# Altium project BopIt Dev.PrjPcb
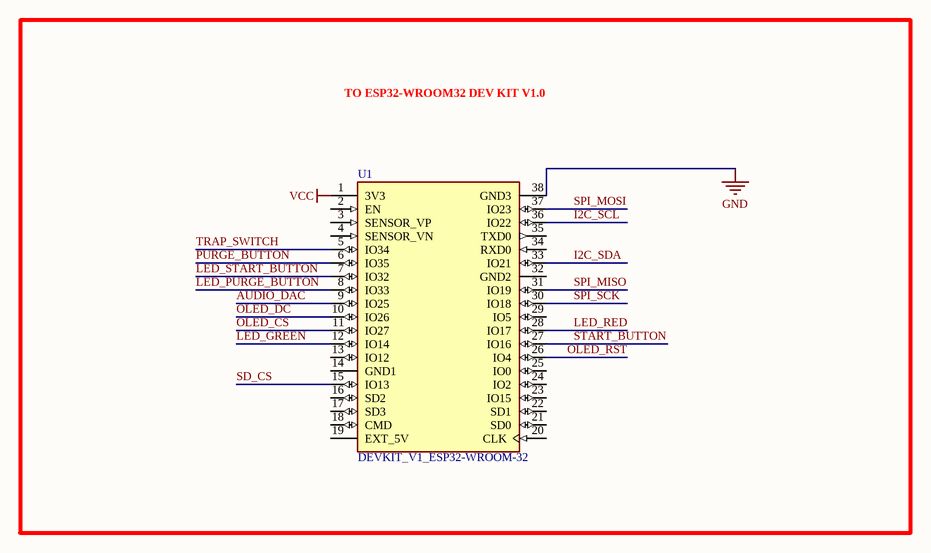
[diagram p0: DevKitESP32.SchDoc]
6 sheets, 20 parts. Net scope: global (net labels, ports and power ports of the same name join across sheets).
Board file: Motherboard.PcbDoc
Sheets:
  DevKitESP32.SchDoc
  Audio.SchDoc
  Display.SchDoc
  Inputs.SchDoc
  Regulators.SchDoc
  Button LED Power.SchDoc

## Sheet DevKitESP32.SchDoc
size A; SheetNumber: 1; SheetTotal: 6

### Parts
U1  DEVKIT_V1_ESP32-WROOM-32  [MODULE_DEVKIT_V1_ESP32-WROOM-32]

### Blocks framed on the sheet
TO ESP32-WROOM32 DEV KIT V1.0: U1

### Nets
GND: U1.38(GND3)
VCC: U1.1(3V3)
AUDIO_DAC: U1.9(IO25)
I2C_SCL: U1.36(IO22)
I2C_SDA: U1.33(IO21)
LED_GREEN: U1.12(IO14)
LED_PURGE_BUTTON: U1.8(IO33)
LED_RED: U1.28(IO17)
LED_START_BUTTON: U1.7(IO32)
OLED_CS: U1.11(IO27)
OLED_DC: U1.10(IO26)
OLED_RST: U1.26(IO4)
PURGE_BUTTON: U1.6(IO35)
SD_CS: U1.15(IO13)
SPI_MISO: U1.31(IO19)
SPI_MOSI: U1.37(IO23)
SPI_SCK: U1.30(IO18)
START_BUTTON: U1.27(IO16)
TRAP_SWITCH: U1.5(IO34)

Not connected (* = marked no-connect by the designer): U1 2(EN) 3(SENSOR_VP) 4(SENSOR_VN) 13(IO12) 14(GND1) 16(SD2) 17(SD3) 18(CMD) 19(EXT_5V) 20(CLK) 21(SD0) 22(SD1) 23(IO15) 24(IO2) 25(IO0) 29(IO5) 32(GND2) 34(RXD0) 35(TXD0)

### Library data of the parts
U1 = DEVKIT_V1_ESP32-WROOM-32: WROOM-32 Development Board ESP32 ESP-32S WiFi Bluetooth Dev Module; MF: Espressif Systems; MP: DEVKIT V1 ESP32-WROOM-32; SnapEDA_Link: https://www.snapeda.com/parts/DEVKIT%20V1%20ESP32-WROOM-32/Espressif+Systems/view-part/?ref=snap; Package: Package; Value: *; Check_prices: https://www.snapeda.com/parts/DEVKIT%20V1%20ESP32-WROOM-32/Espressif+Systems/view-part/?ref=eda

## Sheet Audio.SchDoc
size A; SheetNumber: 2; SheetTotal: 5
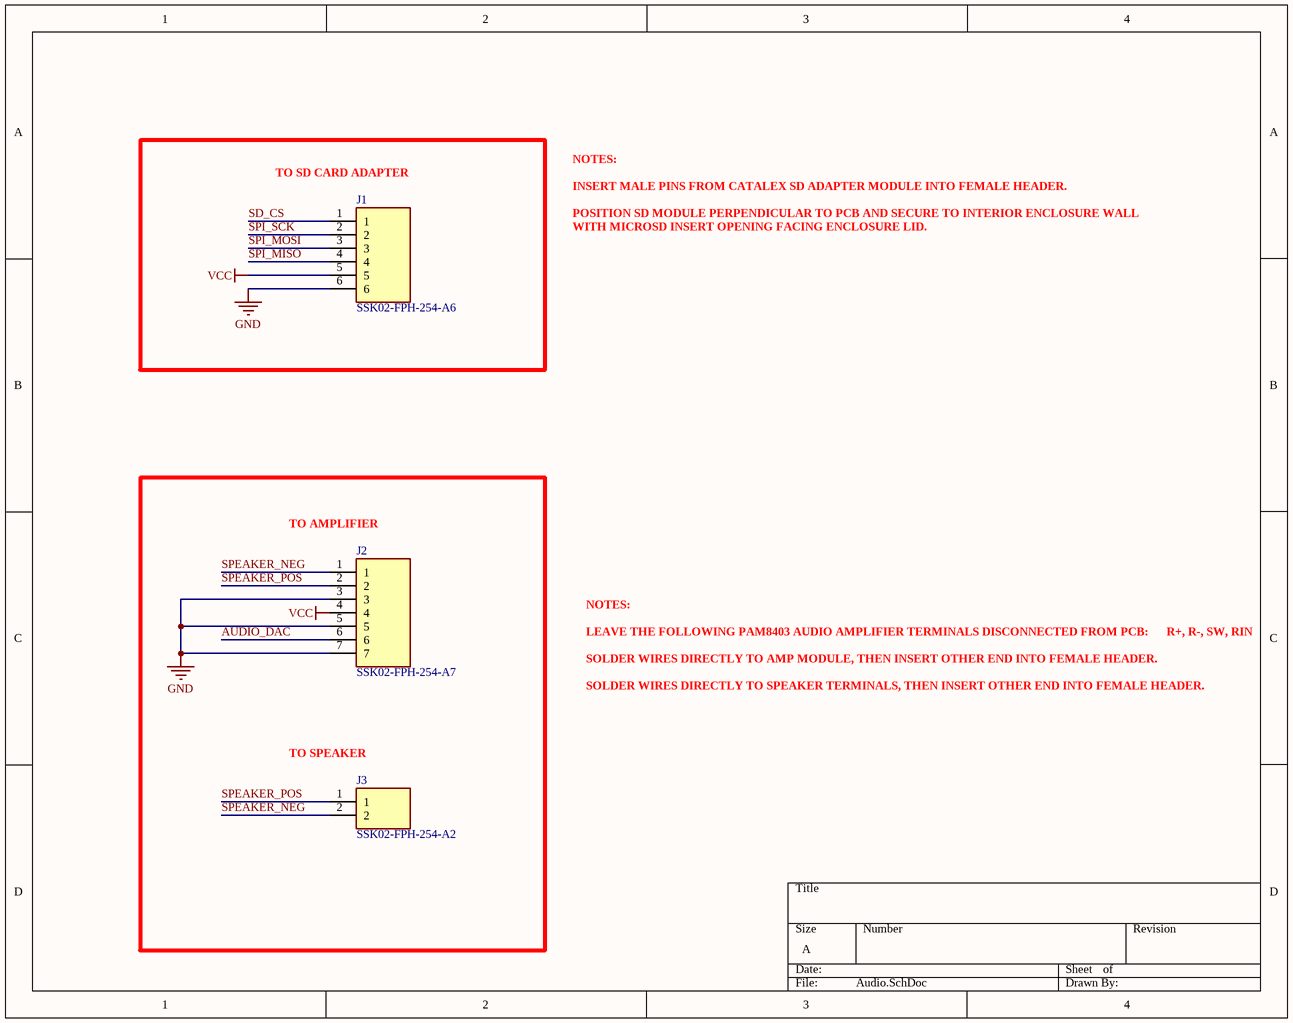
[diagram p1: Audio.SchDoc]

### Parts
J1  SSK02-FPH-254-A6  [SAMESKY_SSK02-FPH-254-A6]
J2  SSK02-FPH-254-A7  [SAMESKY_SSK02-FPH-254-A7]
J3  SSK02-FPH-254-A2  [SAMESKY_SSK02-FPH-254-A2]

### Blocks framed on the sheet
TO SD CARD ADAPTER: J1

### Nets
GND: J1.6 J2.3 J2.5 J2.7
VCC: J1.5 J2.4
AUDIO_DAC: J2.6
SD_CS: J1.1
SPEAKER_NEG: J2.1 J3.2
SPEAKER_POS: J2.2 J3.1
SPI_MISO: J1.4
SPI_MOSI: J1.3
SPI_SCK: J1.2

### Notes on the sheet
- NOTES:
- INSERT MALE PINS FROM CATALEX SD ADAPTER MODULE INTO FEMALE HEADER.
- POSITION SD MODULE PERPENDICULAR TO PCB AND SECURE TO INTERIOR ENCLOSURE WALL
- WITH MICROSD INSERT OPENING FACING ENCLOSURE LID.
- (near J2) TO AMPLIFIER
- LEAVE THE FOLLOWING PAM8403 AUDIO AMPLIFIER TERMINALS DISCONNECTED FROM PCB:
- R+, R-, SW, RIN
- SOLDER WIRES DIRECTLY TO AMP MODULE, THEN INSERT OTHER END INTO FEMALE HEADER.
- SOLDER WIRES DIRECTLY TO SPEAKER TERMINALS, THEN INSERT OTHER END INTO FEMALE HEADER.
- (near J3) TO SPEAKER

### Library data of the parts
J1 = SSK02-FPH-254-A6: 6 Position Header Connector 0.100 (2.54mm) Through Hole Gold; MF: Same Sky (Formerly CUI Devices); SnapEDA_Link: https://www.snapeda.com/parts/SSK02-FPH-254-A6/Same+Sky/view-part/?ref=snap; Package: None; Value: *; MP: SSK02-FPH-254-A6; Check_prices: https://www.snapeda.com/parts/SSK02-FPH-254-A6/Same+Sky/view-part/?ref=eda
J2 = SSK02-FPH-254-A7: MF: {'manufacturer': u'Same Sky (Formerly CUI Devices)'}; Package: None; Price: None; Value: *; MP: SSK02-FPH-254-A7; Availability: Unavailable
J3 = SSK02-FPH-254-A2: 2 Position Header Connector 0.100 (2.54mm) Through Hole Gold; MF: Same Sky (Formerly CUI Devices); SnapEDA_Link: https://www.snapeda.com/parts/SSK02-FPH-254-A2/Same+Sky/view-part/?ref=snap; Package: None; Value: *; MP: SSK02-FPH-254-A2; Check_prices: https://www.snapeda.com/parts/SSK02-FPH-254-A2/Same+Sky/view-part/?ref=eda

## Sheet Display.SchDoc
size A; SheetNumber: 3; SheetTotal: 5
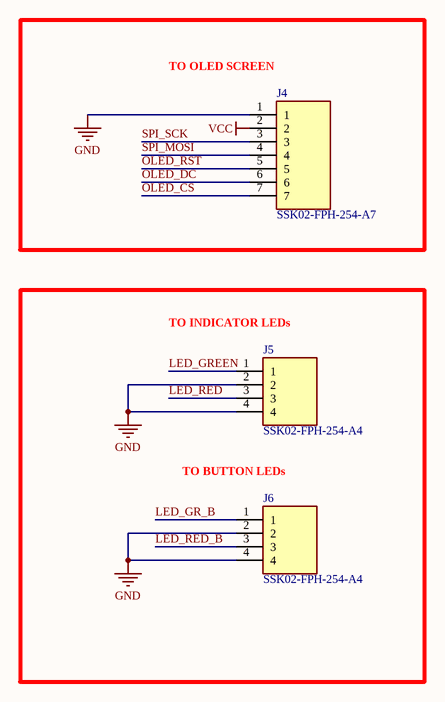
[diagram p2: Display.SchDoc]

### Parts
J4  SSK02-FPH-254-A7  [SAMESKY_SSK02-FPH-254-A7]
J5  SSK02-FPH-254-A4  [SAMESKY_SSK02-FPH-254-A4]
J6  SSK02-FPH-254-A4  [SAMESKY_SSK02-FPH-254-A4]

### Blocks framed on the sheet
TO OLED SCREEN: J4

### Nets
GND: J4.1 J5.2 J5.4 J6.2 J6.4
VCC: J4.2
LED_GR_B: J6.1
LED_GREEN: J5.1
LED_RED: J5.3
LED_RED_B: J6.3
OLED_CS: J4.7
OLED_DC: J4.6
OLED_RST: J4.5
SPI_MOSI: J4.4
SPI_SCK: J4.3

### Notes on the sheet
- (near J5) TO INDICATOR LEDs
- TO BUTTON LEDs

### Library data of the parts
J4 = SSK02-FPH-254-A7: as J2 on sheet Audio; Package: None; Price: None; Value: *; MP: SSK02-FPH-254-A7; Availability: Unavailable
J5 J6 = SSK02-FPH-254-A4: 4 Position Header Connector 0.100 (2.54mm) Through Hole Gold; MF: Same Sky (Formerly CUI Devices); SnapEDA_Link: https://www.snapeda.com/parts/SSK02-FPH-254-A4/Same+Sky/view-part/?ref=snap; Package: None; Value: *; MP: SSK02-FPH-254-A4; Check_prices: https://www.snapeda.com/parts/SSK02-FPH-254-A4/Same+Sky/view-part/?ref=eda

## Sheet Inputs.SchDoc
size A; SheetNumber: 4; SheetTotal: 5
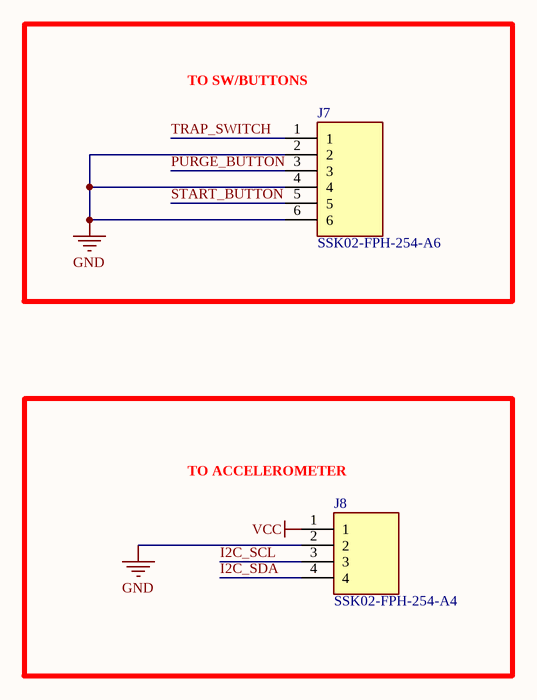
[diagram p3: Inputs.SchDoc]

### Parts
J7  SSK02-FPH-254-A6  [SAMESKY_SSK02-FPH-254-A6]
J8  SSK02-FPH-254-A4  [SAMESKY_SSK02-FPH-254-A4]

### Blocks framed on the sheet
TO SW/BUTTONS: J7
TO ACCELEROMETER: J8

### Nets
GND: J7.2 J7.4 J7.6 J8.2
VCC: J8.1
I2C_SCL: J8.3
I2C_SDA: J8.4
PURGE_BUTTON: J7.3
START_BUTTON: J7.5
TRAP_SWITCH: J7.1

### Library data of the parts
J7 = SSK02-FPH-254-A6: as J1 on sheet Audio; SnapEDA_Link: https://www.snapeda.com/parts/SSK02-FPH-254-A6/Same+Sky/view-part/?ref=snap; Package: None; Value: *; MP: SSK02-FPH-254-A6; Check_prices: https://www.snapeda.com/parts/SSK02-FPH-254-A6/Same+Sky/view-part/?ref=eda
J8 = SSK02-FPH-254-A4: as J5 on sheet Display; SnapEDA_Link: https://www.snapeda.com/parts/SSK02-FPH-254-A4/Same+Sky/view-part/?ref=snap; Package: None; Value: *; MP: SSK02-FPH-254-A4; Check_prices: https://www.snapeda.com/parts/SSK02-FPH-254-A4/Same+Sky/view-part/?ref=eda

## Sheet Regulators.SchDoc
size A; SheetNumber: 5; SheetTotal: 6
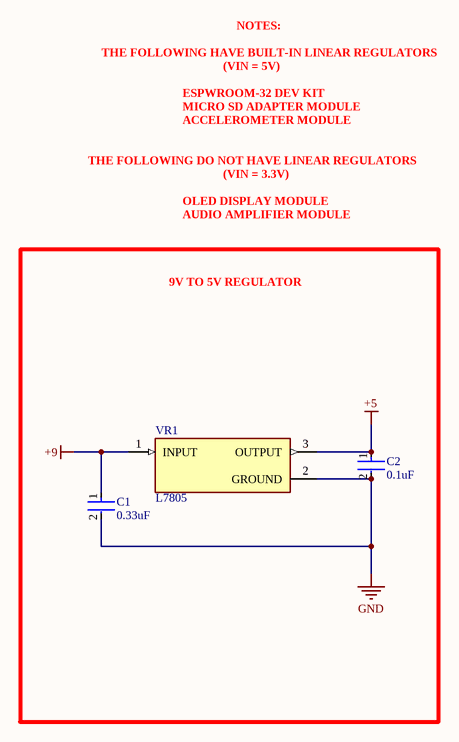
[diagram p4: Regulators.SchDoc]

### Parts
C1  0.33uF  [FP-RHE1DB-MFG]
C2  0.1uF  [FP-RHE1DB-MFG]
VR1  L7805  [TO255P1020X450X2000-3]

### Blocks framed on the sheet
9V TO 5V REGULATOR: C1 C2 VR1

### Nets
+5: C2.1 VR1.3(OUTPUT)
+9: C1.1 VR1.1(INPUT)
GND: C1.2 C2.2 VR1.2(GROUND)

### Notes on the sheet
- THE FOLLOWING HAVE BUILT-IN LINEAR REGULATORS
- (VIN = 5V)
- NOTES:
- MICRO SD ADAPTER MODULE
- ACCELEROMETER MODULE
- ESPWROOM-32 DEV KIT
- THE FOLLOWING DO NOT HAVE LINEAR REGULATORS
- OLED DISPLAY MODULE
- AUDIO AMPLIFIER MODULE
- (VIN = 3.3V)

### Library data of the parts
C1 C2 = CMP-06035-012170-1: Ceramic Capacitor Automotive 330nF ±10% 50V X8L Radial; Tolerance: 10%; Lead Pitch: 2.5mm; Capacitance: 330nF; Max Operating Temperature: 150°C; Dielectric: X8L; Voltage Rating: 50V; Voltage Rating (DC): 50V; Min Operating Temperature: -55°C; REACH SVHC: No SVHC
VR1 = L7805: Standard Regulator Pos 5V 1.5A 3-Pin(3+Tab) TO-220FP Tube; MF: STMicroelectronics; MP: L7805; Value: *; SnapEDA_Link: https://www.snapeda.com/parts/L7805/STMicroelectronics/view-part/?ref=snap; Price: None; Package: None; Check_prices: https://www.snapeda.com/parts/L7805/STMicroelectronics/view-part/?ref=eda; Availability: Not in stock

## Sheet Button LED Power.SchDoc
size A; SheetNumber: 6; SheetTotal: 6
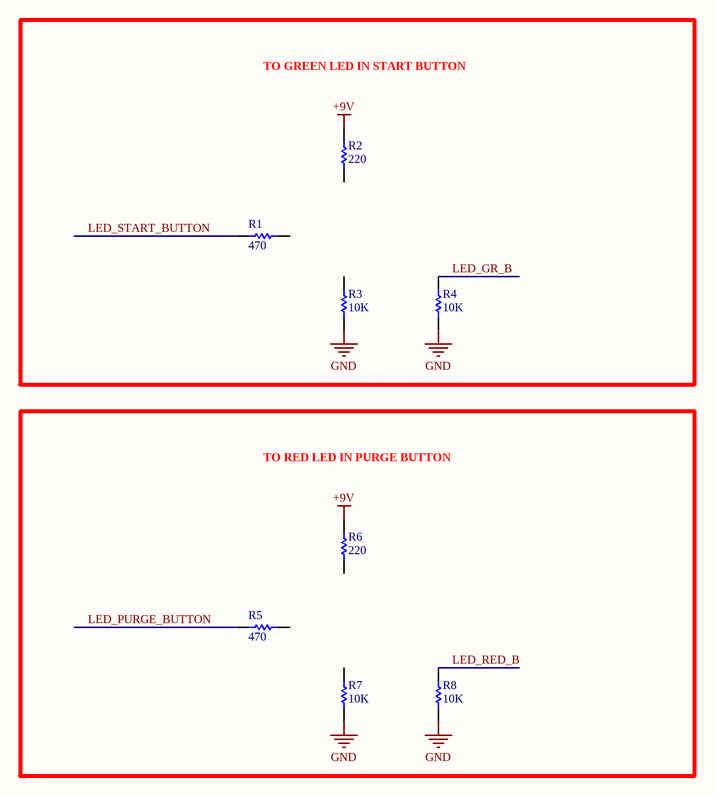
[diagram p5: Button LED Power.SchDoc]

### Parts
R1  470  [RESA60-630X240]
R2  220  [RESA60-630X240]
R3  10K  [RESA60-630X240]
R4  10K  [RESA60-630X240]
R5  470  [RESA60-630X240]
R6  220  [RESA60-630X240]
R7  10K  [RESA60-630X240]
R8  10K  [RESA60-630X240]

### Blocks framed on the sheet
TO GREEN LED IN START BUTTON: R1-R4
TO RED LED IN PURGE BUTTON: R5-R8

### Nets
+9V: R2.2 R6.2
GND: R3.1 R4.1 R7.1 R8.1
LED_GR_B: R4.2
LED_PURGE_BUTTON: R5.1
LED_RED_B: R8.2
LED_START_BUTTON: R1.1

Not connected (* = marked no-connect by the designer): R1 2; R2 1; R3 2; R5 2; R6 1; R7 2

### Library data of the parts
R1-R8 = CMP-1659-00070-1: Axial Resistor, 1 MOhm, +/- 1%, 250 mW, -55 to 155 degC, 2-Pin THD, RoHS, Bulk; Power Rating: 250 mW; Resistance: 47.5 kohm; Voltage Rating: 250 V; ComponentLink1Description: Manufacturer URL; PackageReference: MFR-25; ComponentLink2Description: Datasheet; ComponentLink2URL: http://www.yageo.com/documents/recent/Yageo%20LR_MFR_2013.pdf; Tolerance: 1%; DatasheetVersion: Apr-13; Package Quantity: 200; Packaging: Bulk; Case\Package: Axial; RoHSCompliant: true; ComponentLink1URL: http://www.yageo.com/; Length: 0.248 inch; Min Operating Temperature: -55 degC; Mount: Through Hole; PackageDescription: 2-Pin Axial Lead, Dia 2.4 mm, Body Length 6.3 mm; Max Operating Temperature: 155 degC

## Nets that join several sheets
GND: DevKitESP32 (U1.38), Audio (J1.6 J2.3 J2.5 J2.7), Display (5 pins), Inputs (J7.2 J7.4 J7.6 J8.2), Regulators (C1.2 C2.2 VR1.2), Button LED Power (R3.1 R4.1 R7.1 R8.1)
VCC: DevKitESP32 (U1.1), Audio (J1.5 J2.4), Display (J4.2), Inputs (J8.1)
AUDIO_DAC: DevKitESP32 (U1.9), Audio (J2.6)
I2C_SCL: DevKitESP32 (U1.36), Inputs (J8.3)
I2C_SDA: DevKitESP32 (U1.33), Inputs (J8.4)
LED_GR_B: Display (J6.1), Button LED Power (R4.2)
LED_GREEN: DevKitESP32 (U1.12), Display (J5.1)
LED_PURGE_BUTTON: DevKitESP32 (U1.8), Button LED Power (R5.1)
LED_RED: DevKitESP32 (U1.28), Display (J5.3)
LED_RED_B: Display (J6.3), Button LED Power (R8.2)
LED_START_BUTTON: DevKitESP32 (U1.7), Button LED Power (R1.1)
OLED_CS: DevKitESP32 (U1.11), Display (J4.7)
OLED_DC: DevKitESP32 (U1.10), Display (J4.6)
OLED_RST: DevKitESP32 (U1.26), Display (J4.5)
PURGE_BUTTON: DevKitESP32 (U1.6), Inputs (J7.3)
SD_CS: DevKitESP32 (U1.15), Audio (J1.1)
SPI_MISO: DevKitESP32 (U1.31), Audio (J1.4)
SPI_MOSI: DevKitESP32 (U1.37), Audio (J1.3), Display (J4.4)
SPI_SCK: DevKitESP32 (U1.30), Audio (J1.2), Display (J4.3)
START_BUTTON: DevKitESP32 (U1.27), Inputs (J7.5)
TRAP_SWITCH: DevKitESP32 (U1.5), Inputs (J7.1)